# EAGLE schematic ex1-brd (EAGLE 9.6.2)
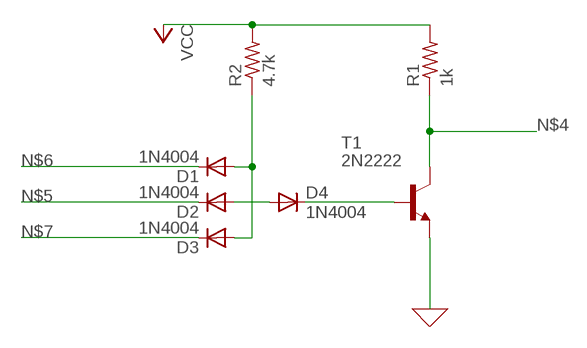
[diagram p0: schematic, sheet 1]

## Parts
D1  1N4004  [DO41-10]
D2  1N4004  [DO41-10]
D3  1N4004  [DO41-10]
D4  1N4004  [DO41-10]
R1  1k  FLIPFLOP-RES  [0805-THM]
R2  4.7k  FLIPFLOP-RES  [0805-THM]
T1  2N2222  [TO92-EBC-OVAL]

## Nets
0: T1.E ; supply symbol labelled GND
N$1: D4.C T1.B
N$2: D1.A D3.A R2.1
N$3: D2.A D4.A
N$4: R1.1 T1.C
N$5: D2.C
N$6: D1.C
N$7: D3.C
VCC: R1.2 R2.2

## Library data of the parts
D1-D4 = adafruit:1N4004: DIODE General purpose 1N400x type rectifier (With bigger pads) http://www.ladyada.net/library/pcb/eaglelibrary.html
R1 R2 = adafruit:FLIPFLOP-RES: Flip Flop resistor An 0805 resistor inside a standard 1/4W 5% resistor. Makes for easy mods
T1 = adafruit:2N2222: NPN TRANSISTOR Big oval pads